# Altium project OFP_CIM_v1.5.PrjPcb (part 2 of 2)

## Sheet Power-Processor-3-Sheet.SchDoc
size 420 x 297 mm; SheetNumber: 3; SheetTotal: 4
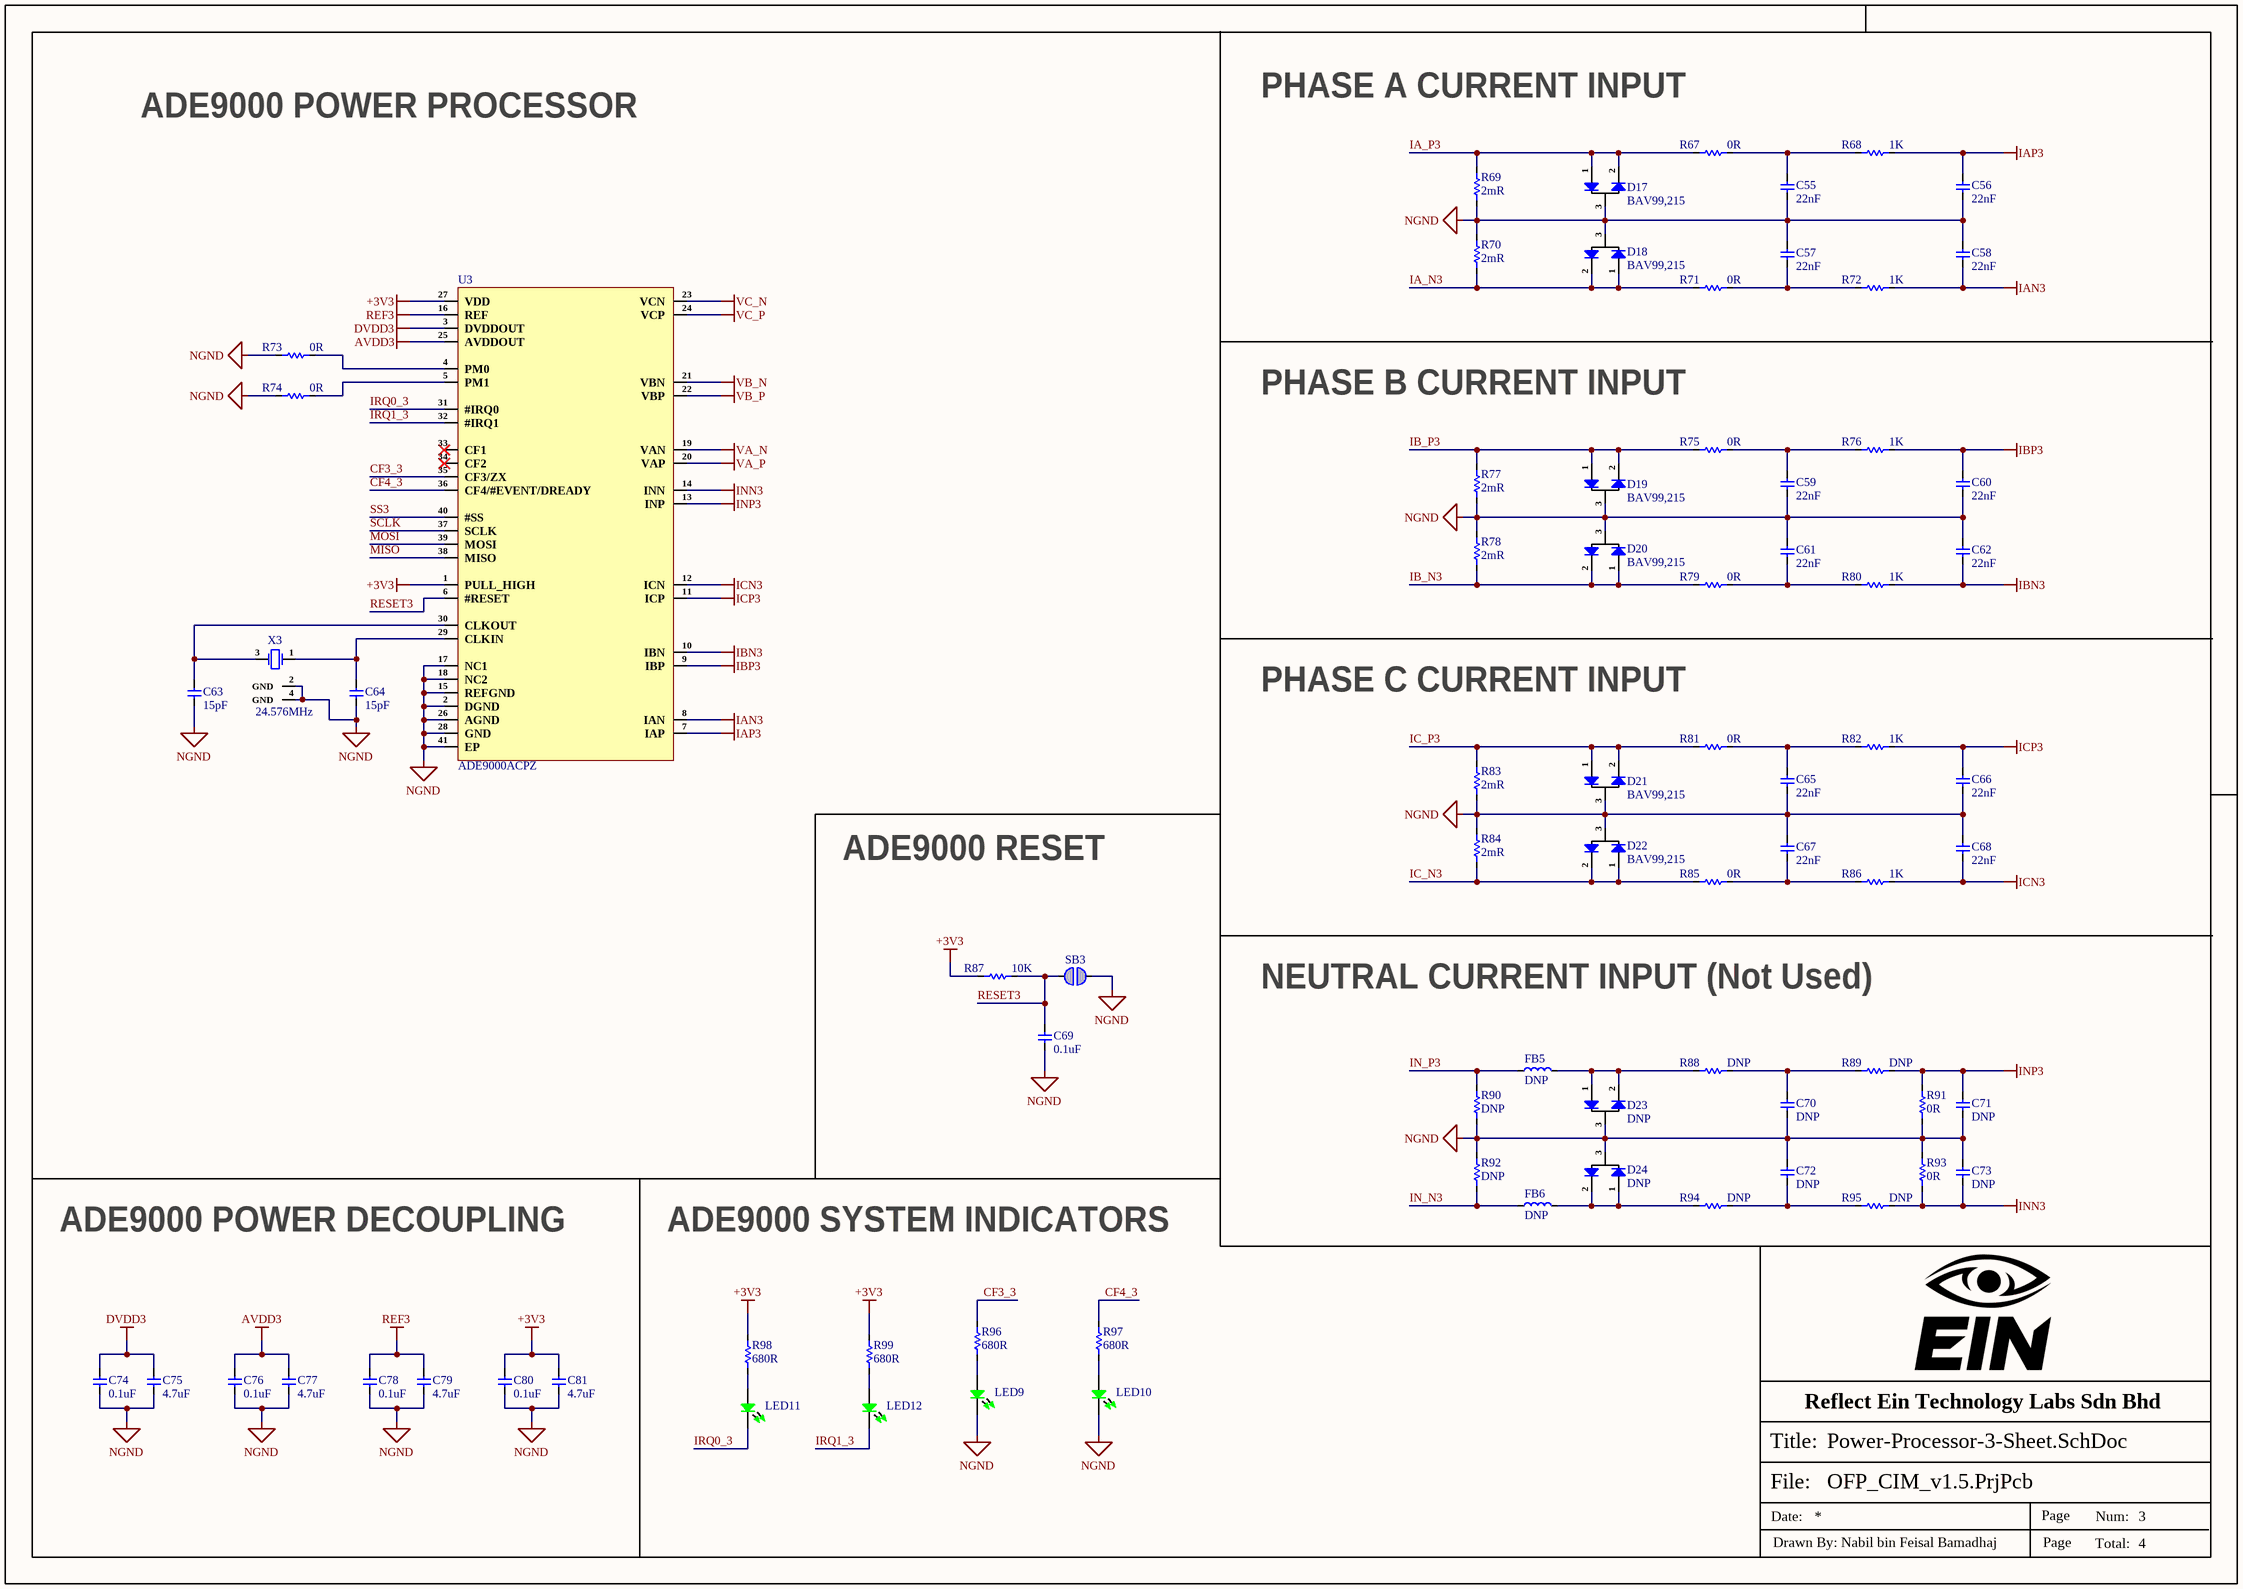
[diagram p2: Power-Processor-3-Sheet.SchDoc]

### Parts
C55  22nF  [Cap-0805]
C56  22nF  [Cap-0805]
C57  22nF  [Cap-0805]
C58  22nF  [Cap-0805]
C59  22nF  [Cap-0805]
C60  22nF  [Cap-0805]
C61  22nF  [Cap-0805]
C62  22nF  [Cap-0805]
C63  15pF  [Cap-0603]
C64  15pF  [Cap-0603]
C65  22nF  [Cap-0805]
C66  22nF  [Cap-0805]
C67  22nF  [Cap-0805]
C68  22nF  [Cap-0805]
C69  0.1uF  [Cap-0603]
C70  DNP  [Cap-0805]  (no BOM)
C71  DNP  [Cap-0805]  (no BOM)
C72  DNP  [Cap-0805]  (no BOM)
C73  DNP  [Cap-0805]  (no BOM)
C74  0.1uF  [Cap-0603]
C75  4.7uF  [Cap-0603]
C76  0.1uF  [Cap-0603]
C77  4.7uF  [Cap-0603]
C78  0.1uF  [Cap-0603]
C79  4.7uF  [Cap-0603]
C80  0.1uF  [Cap-0603]
C81  4.7uF  [Cap-0603]
D17  BAV99,215  [SOT-23]
D18  BAV99,215  [SOT-23]
D19  BAV99,215  [SOT-23]
D20  BAV99,215  [SOT-23]
D21  BAV99,215  [SOT-23]
D22  BAV99,215  [SOT-23]
D23  DNP  [SOT-23]  (no BOM)
D24  DNP  [SOT-23]  (no BOM)
FB5  DNP  [Ind-0805]  (no BOM)
FB6  DNP  [Ind-0805]  (no BOM)
LED9  Emerald  [LED-0603]  (value not drawn)
LED10  Emerald  [LED-0603]  (value not drawn)
LED11  Emerald  [LED-0603]  (value not drawn)
LED12  Emerald  [LED-0603]  (value not drawn)
R67  0R  [Res-0603]
R68  1K  [Res-0603]
R69  2mR  [RES-2512]
R70  2mR  [RES-2512]
R71  0R  [Res-0603]
R72  1K  [Res-0603]
R73  0R  [Res-0603]
R74  0R  [Res-0603]
R75  0R  [Res-0603]
R76  1K  [Res-0603]
R77  2mR  [RES-2512]
R78  2mR  [RES-2512]
R79  0R  [Res-0603]
R80  1K  [Res-0603]
R81  0R  [Res-0603]
R82  1K  [Res-0603]
R83  2mR  [RES-2512]
R84  2mR  [RES-2512]
R85  0R  [Res-0603]
R86  1K  [Res-0603]
R87  10K  [Res-0603]
R88  DNP  [Res-0603]  (no BOM)
R89  DNP  [Res-0603]  (no BOM)
R90  DNP  [RES-2512]  (no BOM)
R91  0R  [Res-0603]
R92  DNP  [RES-2512]  (no BOM)
R93  0R  [Res-0603]
R94  DNP  [Res-0603]  (no BOM)
R95  DNP  [Res-0603]  (no BOM)
R96  680R  [Res-0603]
R97  680R  [Res-0603]
R98  680R  [Res-0603]
R99  680R  [Res-0603]
SB3  Solder Bridge 0603  [Solder Bridge]  (value not drawn)  (no BOM)
U3  ADE9000ACPZ  [40-LFCSP-WQ (6x6)]
X3  24.576MHz  [SMD3225-4P]

### Nets
+3V3: C80.2 C81.2 R87.1 R98.2 R99.2 U3.1(PULL_HIGH) U3.27(VDD)
AVDD3: C76.2 C77.2 U3.25(AVDDOUT)
DVDD3: C74.2 C75.2 U3.3(DVDDOUT)
IAN3: C58.1 R72.2 U3.8(IAN)
IAP3: C56.2 R68.2 U3.7(IAP)
IBN3: C62.1 R80.2 U3.10(IBN)
IBP3: C60.2 R76.2 U3.9(IBP)
ICN3: C68.1 R86.2 U3.12(ICN)
ICP3: C66.2 R82.2 U3.11(ICP)
INN3: C73.1 R93.1 R95.2 U3.14(INN)
INP3: C71.2 R89.2 R91.2 U3.13(INP)
NGND: C55.1 C56.1 C57.2 C58.2 C59.1 C60.1 C61.2 C62.2 C63.1 C64.1 C65.1 C66.1 C67.2 C68.2 C69.1 C70.1 C71.1 C72.2 C73.2 C74.1 C75.1 C76.1 C77.1 C78.1 C79.1 C80.1 C81.1 D17.3 D18.3 D19.3 D20.3 D21.3 D22.3 D23.3 D24.3 LED9.2 LED10.2 R69.1 R70.2 R73.1 R74.1 R77.1 R78.2 R83.1 R84.2 R90.1 R91.1 R92.2 R93.2 SB3.1 U3.2(DGND) U3.15(REFGND) U3.17(NC1) U3.18(NC2) U3.26(AGND) U3.28(GND) U3.41(EP) X3.2(GND) X3.4(GND)
REF3: C78.2 C79.2 U3.16(REF)
VA_N: U3.19(VAN)
VA_P: U3.20(VAP)
VB_N: U3.21(VBN)
VB_P: U3.22(VBP)
VC_N: U3.23(VCN)
VC_P: U3.24(VCP)
CF3_3: R96.2 U3.35(CF3/ZX)
CF4_3: R97.2 U3.36(CF4/#EVENT/DREADY)
IA_N3: D18.1 D18.2 R70.1 R71.1
IA_P3: D17.1 D17.2 R67.1 R69.2
IB_N3: D20.1 D20.2 R78.1 R79.1
IB_P3: D19.1 D19.2 R75.1 R77.2
IC_N3: D22.1 D22.2 R84.1 R85.1
IC_P3: D21.1 D21.2 R81.1 R83.2
IN_N3: FB6.1 R92.1
IN_P3: FB5.1 R90.2
IRQ0_3: LED11.2 U3.31(#IRQ0)
IRQ1_3: LED12.2 U3.32(#IRQ1)
MISO: U3.38(MISO)
MOSI: U3.39(MOSI)
RESET3: C69.2 R87.2 SB3.2 U3.6(#RESET)
SCLK: U3.37(SCLK)
SS3: U3.40(#SS)
NetC55_2: C55.2 R67.2 R68.1
NetC57_1: C57.1 R71.2 R72.1
NetC59_2: C59.2 R75.2 R76.1
NetC61_1: C61.1 R79.2 R80.1
NetC63_2: C63.2 U3.30(CLKOUT) X3.3(CRYSTAL)
NetC64_2: C64.2 U3.29(CLKIN) X3.1(CRYSTAL)
NetC65_2: C65.2 R81.2 R82.1
NetC67_1: C67.1 R85.2 R86.1
NetC70_2: C70.2 R88.2 R89.1
NetC72_1: C72.1 R94.2 R95.1
NetD23_1: D23.1 D23.2 FB5.2 R88.1
NetD24_1: D24.1 D24.2 FB6.2 R94.1
NetLED9_1: LED9.1 R96.1
NetLED10_1: LED10.1 R97.1
NetLED11_1: LED11.1 R98.1
NetLED12_1: LED12.1 R99.1
NetR73_2: R73.2 U3.4(PM0)
NetR74_2: R74.2 U3.5(PM1)

Not connected (* = marked no-connect by the designer): U3 33(CF1)* 34(CF2)*

### Notes on the sheet
- ADE9000 POWER PROCESSOR
- PHASE A CURRENT INPUT
- PHASE B CURRENT INPUT
- PHASE C CURRENT INPUT
- ADE9000 RESET
- NEUTRAL CURRENT INPUT (Not Used)
- ADE9000 POWER DECOUPLING
- ADE9000 SYSTEM INDICATORS
- Reflect Ein Technology Labs Sdn Bhd
- File:
- Title:
- Date:
- Page
- Num:
- Total:
- Drawn By: Nabil bin Feisal Bamadhaj

### Library data of the parts
C55-C62 C65-C68 C70-C73 = GRM21B5C1H223JA01L: CAP CER 0.022UF 50V C0G/NP0 0805; Manufacturer: Murata; Item Type: Capacitors; Supplier: Mouser; LCSC Part Number: C77069; Manufacturer Part Number: GRM21B5C1H223JA01L; RoHS: Yes; Stock: 33939; Pricing: 1=0.38, 10=0.162, 50=0.162, 100=0.108, 1000=0.089, 10000=0.065 (USD); Lead Free: 5697LeadFree; ComponentLink1URL: https://datasheet.ciiva.com/29042/1858738-29042965.pdf?src-supplier=Jameco; ComponentLink1Description: https://datasheet.ciiva.com/29042/1858738-29042965.pdf?src-supplier=Jameco; ComponentLink2URL: https://datasheet.ciiva.com/2989/product-2989681.pdf?src-supplier=Avnet; ComponentLink2Description: https://datasheet.ciiva.com/2989/product-2989681.pdf?src-supplier=Avnet; ComponentLink3URL: https://datasheet.ciiva.com/3777/99grm21b5c1h223ja0123-3777023.pdf?src-supplier=Arrow+Electronics; ComponentLink3Description: https://datasheet.ciiva.com/3777/99grm21b5c1h223ja0123-3777023.pdf?src-supplier=Arrow+Electronics; ComponentLink4URL: https://datasheet.ciiva.com/29200/453051-da-01-en-vs-kondensator-0805-29200670.pdf?src-supplier=Conrad; ComponentLink4Description: https://datasheet.ciiva.com/29200/453051-da-01-en-vs-kondensator-0805-29200670.pdf?src-supplier=Conrad; ComponentLink5URL: https://datasheet.ciiva.com/138/partnumbering-e-01-138787.pdf?src-supplier=Digikey; ComponentLink5Description: https://datasheet.ciiva.com/138/partnumbering-e-01-138787.pdf?src-supplier=Digikey; ComponentLink6URL: https://datasheet.ciiva.com/138/partnumbering-e-01-138788.pdf?src-supplier=Digikey; ComponentLink6Description: https://datasheet.ciiva.com/138/partnumbering-e-01-138788.pdf?src-supplier=Digikey; ComponentLink7URL: https://datasheet.ciiva.com/138/partnumbering-e-01-138789.pdf?src-supplier=Digikey; ComponentLink7Description: https://datasheet.ciiva.com/138/partnumbering-e-01-138789.pdf?src-supplier=Digikey; ComponentLink8URL: https://datasheet.ciiva.com/22703/608985-22703464.pdf?src-supplier=Element14; ComponentLink8Description: https://datasheet.ciiva.com/22703/608985-22703464.pdf?src-supplier=Element14; ComponentLink9URL: https://datasheet.ciiva.com/7828/608985-7828990.pdf?src-supplier=Element14; ComponentLink9Description: https://datasheet.ciiva.com/7828/608985-7828990.pdf?src-supplier=Element14
C63 C64 = CC0603JRNPO9BN150: CAP CER 15PF 50V C0G/NPO 0603; Manufacturer: Yageo; Dielectric Material: Ceramic; Tolerance: 5%; Dielectric: C0G; Insulation Resistance: 100GR; Item Type: Capacitor; Supplier 1: Future Electronics; Manufacturer Part Number: CC0603JRNPO9BN150; RoHS: Yes; Category: Ceramic Capacitors; Stock 1: 832000; Pricing 1: 4000=0.0038, 16000=0.0036, 80000=0.0034, 160000=0.0033, 500000=0.0031 (USD); Mounting Technology: Surface Mount; Case/Package: 0603; Pins: 2; Case Code (Metric): 1608; Case Code (Imperial): 0603; Min Operating Temperature: -55°C; Max Operating Temperature: 125°C; Value: 15pF; Series: CC; Packaging: Tape and Reel; Package Quantity: 1; Termination: SMD/SMT; Voltage Rating: 50V; Length: 1.6mm; Width: 0.031inch; Height: 0.8mm; Depth: 0.8mm; Thickness: 0.035inch; Radiation Hardening: No; RoHS Compliant: Yes; Reach SVHC Compliant: No; Lead Free: Lead Free; ComponentLink1URL: https://datasheet.ciiva.com/144/mlccorderingcode-144635.pdf?src-supplier=Digi-Key; ComponentLink1Description: https://datasheet.ciiva.com/144/mlccorderingcode-144635.pdf?src-supplier=Digi-Key; ComponentLink2URL: https://datasheet.ciiva.com/144/mlccorderingcode-144636.pdf?src-supplier=Digi-Key; ComponentLink2Description: https://datasheet.ciiva.com/144/mlccorderingcode-144636.pdf?src-supplier=Digi-Key; ComponentLink3URL: https://datasheet.ciiva.com/8033/1443161-8033721.pdf?src-supplier=Element14; ComponentLink3Description: https://datasheet.ciiva.com/8033/1443161-8033721.pdf?src-supplier=Element14; ComponentLink4URL: https://datasheet.ciiva.com/28450/1443161-28450472.pdf?src-supplier=Element14; ComponentLink4Description: https://datasheet.ciiva.com/28450/1443161-28450472.pdf?src-supplier=Element14; ComponentLink5URL: https://datasheet.ciiva.com/144/mlccorderingcode-144634.pdf?src-supplier=Digi-Key; ComponentLink5Description: https://datasheet.ciiva.com/144/mlccorderingcode-144634.pdf?src-supplier=Digi-Key; ComponentLink6URL: https://datasheet.ciiva.com/8033/1734582-8033723.pdf?src-supplier=Element14; ComponentLink6Description: https://datasheet.ciiva.com/8033/1734582-8033723.pdf?src-supplier=Element14; ComponentLink7URL: https://datasheet.ciiva.com/8033/1734582-8033722.pdf?src-supplier=Element14; ComponentLink7Description: https://datasheet.ciiva.com/8033/1734582-8033722.pdf?src-supplier=Element14; ComponentLink8URL: https://datasheet.ciiva.com/11464/upy-gp-np0-16v-to-50v-8-11464727.pdf?src-supplier=Avnet; ComponentLink8Description: https://datasheet.ciiva.com/11464/upy-gp-np0-16v-to-50v-8-11464727.pdf?src-supplier=Avnet; Supplier Part Number 1: 4234670; LCSC Part Number: C107037
C69 C74 C76 C78 C80 = GCJ188R71H104KA12D: CAP CER 0.1UF 50V X7R 0603; Manufacturer: Murata; Item Type: Capacitors; Material: 4241ConductorMaterial; Value: 100nF; Tolerance: 10%; Supplier: Mouser; LCSC Part Number: C161115; Manufacturer Part Number: GCJ188R71H104KA12D; RoHS: Yes; Stock: 342536; Pricing: 1=0.13, 10=0.056, 50=0.056, 100=0.036, 1000=0.032, 10000=0.02 (USD); Mounting Technology: Surface Mount; Case/Package: 0603; Case Code (Metric): 1608; Case Code (Imperial): 0603; Min Operating Temperature: -55°C; Max Operating Temperature: 125°C; Dielectric: X7R; Package Quantity: 1; Voltage Rating: 50V; Packaging: Tape and Reel; Voltage Rating (DC): 50V; Termination: SMD/SMT; Features: Soft Termination; Series: GCJ; Construction: Flat; Length: 1.6mm; Width: 0.031inch; Height: 0.8mm; Thickness: 0.035inch; Depth: 0.8mm; Ratings: AEC-Q200; Radiation Hardening: No; RoHS Compliant: Yes; Lead Free: 5697LeadFree; ComponentLink1URL: https://datasheet.ciiva.com/135/product-135604.pdf?src-supplier=Digikey; ComponentLink1Description: https://datasheet.ciiva.com/135/product-135604.pdf?src-supplier=Digikey; ComponentLink2URL: https://datasheet.ciiva.com/26889/getdatasheetpartid-369886-26889118.pdf?src-supplier=Verical; ComponentLink2Description: https://datasheet.ciiva.com/26889/getdatasheetpartid-369886-26889118.pdf?src-supplier=Verical; ComponentLink3URL: https://datasheet.ciiva.com/135/s0717e-135605.pdf?src-supplier=Digikey; ComponentLink3Description: https://datasheet.ciiva.com/135/s0717e-135605.pdf?src-supplier=Digikey; ComponentLink4URL: https://datasheet.ciiva.com/135/s0717e-135606.pdf?src-supplier=Digikey; ComponentLink4Description: https://datasheet.ciiva.com/135/s0717e-135606.pdf?src-supplier=Digikey; ComponentLink5URL: https://datasheet.ciiva.com/16440/c03e-16440425.pdf?src-supplier=Future+Electronics; ComponentLink5Description: https://datasheet.ciiva.com/16440/c03e-16440425.pdf?src-supplier=Future+Electronics
C75 C77 C79 C81 = GRM188Z71A475KE15D: CAP CER 4.7UF 10V X7R 0603; Manufacturer: Murata; Item Type: Capacitors; Material: 4241ConductorMaterial; Tolerance: 10%; Supplier: Mouser; LCSC Part Number: C913474; Manufacturer Part Number: GRM188Z71A475KE15D; RoHS: Yes; Stock: 33218; Pricing: 1=0.24, 10=0.1, 50=0.1, 100=0.063, 1000=0.055, 10000=0.041 (USD); Case/Package: 0603; Min Operating Temperature: -55°C; Max Operating Temperature: 125°C; Value: 4.7uF; Voltage Rating: 10V; Length: 1.6mm; Width: 800um; Height: 950um; Thickness: 800um; RoHS Compliant: Yes; ComponentLink1URL: https://datasheet.octopart.com/GRM188Z71A475KE15D-Murata-datasheet-149523299.pdf?src-supplier=Newark; ComponentLink1Description: https://datasheet.octopart.com/GRM188Z71A475KE15D-Murata-datasheet-149523299.pdf?src-supplier=Newark; ComponentLink2URL: https://datasheet.octopart.com/GRM188Z71A475KE15D-Murata-datasheet-165579666.pdf?src-supplier=TME; ComponentLink2Description: https://datasheet.octopart.com/GRM188Z71A475KE15D-Murata-datasheet-165579666.pdf?src-supplier=TME
D17-D24 = BAV99,215: DIODE ARR GP 100V 215MA TO-236AB; Manufacturer: Nexperia; Item Type: Diodes; Forward Voltage: 1.25V; Breakdown Voltage: 75V; Forward Current: 125mA; Max Forward Surge Current (Ifsm): 500mA; Max Reverse Current: 500nA; Value: 1.5pF; Supplier: Future Electronics; LCSC Part Number: C2500; Manufacturer Part Number: BAV99,215; RoHS: Yes; Stock: 20217000; Pricing: 3000=0.008, 12000=0.0077, 30000=0.0075, 75000=0.0073, 120000=0.007 (USD); Pins: 3NUMBER; Max Operating Temperature: 150°C; Max Repetitive Reverse Voltage (Vrrm): 100V; Reverse Voltage: 100V; Height: 1.1mm; RoHS Compliant: Yes; ComponentLink1URL: http://www.farnell.com/datasheets/953882.pdf?src-supplier=Farnell; ComponentLink1Description: http://www.farnell.com/datasheets/953882.pdf?src-supplier=Farnell; ComponentLink2URL: http://www.farnell.com/datasheets/953882.pdf?src-supplier=Newark; ComponentLink2Description: http://www.farnell.com/datasheets/953882.pdf?src-supplier=Newark; ComponentLink3URL: https://datasheet.octopart.com/BAV99%2C215-Nexperia-datasheet-10109661.pdf?src-supplier=Element14; ComponentLink3Description: https://datasheet.octopart.com/BAV99%2C215-Nexperia-datasheet-10109661.pdf?src-supplier=Element14; ComponentLink4URL: https://assets.nexperia.com/documents/data-sheet/BAV99_SER.pdf?src-supplier=Digikey; ComponentLink4Description: https://assets.nexperia.com/documents/data-sheet/BAV99_SER.pdf?src-supplier=Digikey; ComponentLink5URL: https://datasheet.octopart.com/BAV99%2C215-Nexperia-datasheet-87580883.pdf?src-supplier=Newark; ComponentLink5Description: https://datasheet.octopart.com/BAV99%2C215-Nexperia-datasheet-87580883.pdf?src-supplier=Newark
FB5 FB6 = BLM21BD152SN1D: FERRITE BEAD 1.5 KOHM 0805 1LN; Manufacturer: Murata; Item Type: Ferrite Beads; RMS Current (Irms): 250mA; ESR: 450mR; Shielding: 202Shielding; Frequency: 100MHz; Number of Circuits: 1NUMBER; Supplier: Mouser; LCSC Part Number: C413959; Manufacturer Part Number: BLM21BD152SN1D; RoHS: Yes; Stock: 31999; Pricing: 1=0.21, 10=0.114, 50=0.114, 100=0.102, 1000=0.068, 10000=0.048 (USD); Lead Free: 5697LeadFree; ComponentLink1URL: https://datasheet.ciiva.com/19454/1845267-19454720.pdf?src-supplier=Jameco; ComponentLink1Description: https://datasheet.ciiva.com/19454/1845267-19454720.pdf?src-supplier=Jameco; ComponentLink2URL: https://datasheet.ciiva.com/14122/amblm21b-data-e-14122891.pdf?src-supplier=Distrelec; ComponentLink2Description: https://datasheet.ciiva.com/14122/amblm21b-data-e-14122891.pdf?src-supplier=Distrelec; ComponentLink3URL: https://datasheet.ciiva.com/6211/l0110s0100blm21b-6211484.pdf?src-supplier=Digikey; ComponentLink3Description: https://datasheet.ciiva.com/6211/l0110s0100blm21b-6211484.pdf?src-supplier=Digikey; ComponentLink4URL: https://datasheet.ciiva.com/6211/l0110s0100blm21b-6211486.pdf?src-supplier=Digikey; ComponentLink4Description: https://datasheet.ciiva.com/6211/l0110s0100blm21b-6211486.pdf?src-supplier=Digikey; ComponentLink5URL: https://datasheet.ciiva.com/6211/l0110s0100blm21b-6211487.pdf?src-supplier=Digikey; ComponentLink5Description: https://datasheet.ciiva.com/6211/l0110s0100blm21b-6211487.pdf?src-supplier=Digikey; ComponentLink6URL: https://datasheet.ciiva.com/16420/l0110s0100blm21b-16420715.pdf?src-supplier=Future+Electronics; ComponentLink6Description: https://datasheet.ciiva.com/16420/l0110s0100blm21b-16420715.pdf?src-supplier=Future+Electronics; ComponentLink7URL: https://datasheet.ciiva.com/17277/l0110s0100blm21b-17277370.pdf?; ComponentLink7Description: https://datasheet.ciiva.com/17277/l0110s0100blm21b-17277370.pdf?
LED9-LED12 = NCD0603G2: Emerald 0603 Light Emitting Diodes (LED) ROHS; Manufacturer: Foshan NationStar Optoelectronics; Manufacturer Part Number: NCD0603G2; Package: 0603; LCSC Part Number: C87326; Item Type: LED; ComponentLink1Description: LCSC; ComponentLink1URL: https://www.lcsc.com/product-detail/Light-Emitting-Diodes-LED_Foshan-NationStar-Optoelectronics-NCD0603G2_C87326.html
R67 R71 R73-R75 R79 R81 R85 R88 R91 R93 R94 = RC0603FR-070RL: RES SMD 0R, 1%, 0.1W, 0603; Manufacturer: Yageo; Item Type: Resistor; Manufacturer Part Number: RC0603FR-070RL; Package: 0603; LCSC Part Number: C100044; ComponentLink9Description: LCSC; ComponentLink9URL: https://www.lcsc.com/product-detail/Chip-Resistor-Surface-Mount_YAGEO-RC0603FR-070RL_C100044.html
R68 R72 R76 R80 R82 R86 R89 R95 = RC0603FR-071KL: RES SMD 1K OHM 1% 1/10W 0603; Manufacturer: Yageo; Resistance: 1kR; Temperature Coefficient: 100ppm/°C; Power Rating: 100mW; Voltage Rating: 50V; Item type: Resistor; ComponentLink1URL: https://www.verical.com/server-webapp/html/getDatasheet?partID=409289&src-supplier=Verical; ComponentLink1Description: https://www.verical.com/server-webapp/html/getDatasheet?partID=409289&src-supplier=Verical; Supplier 1: Digi-Key; Manufacturer Part Number: RC0603FR-071KL; Stock 1: 21472395; Pricing 1: 1=0.1, 10=0.023, 100=0.0094, 1000=0.0042, 2500=0.0037 (USD); Case/Package: 0603; Contact Plating: Tin,Matte; Case Code (Imperial): 0603; Case Code (Metric): 1608; Min Operating Temperature: -55°C; Max Operating Temperature: 155°C; Tolerance: 1%; Composition: Thick Film; Packaging: Tape and Reel; Termination: SMD/SMT; Military Standard: Not; Length: 1.6mm; Height: 0.45mm; Depth: 0.8mm; Radiation Hardening: No; REACH SVHC: No SVHC; Lead Free: Lead Free; ComponentLink2URL: http://documents.rs-components.com/techlib://itc_doclist_GB.htm?stockno=5048928&src-supplier=RSComponents; ComponentLink2Description: http://documents.rs-components.com/techlib://itc_doclist_GB.htm?stockno=5048928&src-supplier=RSComponents; ComponentLink3URL: http://www.yageo.com/documents/recent/PYu-RC0603_51_RoHS_L_4.pdf?src-supplier=Avnet+Europe; ComponentLink3Description: http://www.yageo.com/documents/recent/PYu-RC0603_51_RoHS_L_4.pdf?src-supplier=Avnet+Europe; ComponentLink4URL: http://www.farnell.com/datasheets/2167052.pdf?src-supplier=Element14; ComponentLink4Description: http://www.farnell.com/datasheets/2167052.pdf?src-supplier=Element14; ComponentLink5URL: http://www.farnell.com/datasheets/1868787.pdf?src-supplier=Element14; ComponentLink5Description: http://www.farnell.com/datasheets/1868787.pdf?src-supplier=Element14; ComponentLink6URL: http://www.yageo.com/documents/recent/PYu-RC_Group_51_RoHS_L_2.pdf?src-supplier=Avnet; ComponentLink6Description: http://www.yageo.com/documents/recent/PYu-RC_Group_51_RoHS_L_2.pdf?src-supplier=Avnet; ComponentLink7URL: https://www.verical.com/server-webapp/html/getDatasheet?partID=404327&src-supplier=Verical; ComponentLink7Description: https://www.verical.com/server-webapp/html/getDatasheet?partID=404327&src-supplier=Verical; ComponentLink8URL: http://www.farnell.com/datasheets/443971.pdf?src-supplier=Element14; ComponentLink8Description: http://www.farnell.com/datasheets/443971.pdf?src-supplier=Element14; Supplier Part Number 1: 311-1.00KHRDKR-ND; LCSC Part Number: C22548
R69 R70 R77 R78 R83 R84 R90 R92 = PA2512FKE7T0R002E: RES 0.002 OHM 1% 3W 2512; Manufacturer: Yageo; Item Type: Resistors; Supplier: Digikey; LCSC Part Number: C375692; Manufacturer Part Number: PA2512FKE7T0R002E; RoHS: Yes; Stock: 3531; Pricing: 1=0.87, 10=0.754, 25=0.662, 50=0.5936, 100=0.5253, 250=0.45696, 500=0.37944, 1000=0.31212 (USD)
R87 = RC0603FR-0710KL: RES SMD 10K Ohm 1% 1/10W 0603; Manufacturer: Yageo; Resistance: 10kR; Temperature Coefficient: 100ppm/°C; Voltage Rating (DC): 50V; Power Rating: 100mW; Voltage Rating: 75V; Item Type: Resistor; Supplier 1: Digi-Key; Manufacturer Part Number: RC0603FR-0710KL; RoHS: Yes; Category: Chip SMD Resistors; Stock 1: 25249139; Pricing 1: 1=0.10000, 10=0.02400, 100=0.00970, 1000=0.00436, 2500=0.00378 (USD); Case/Package: 0603; Number of Pins: 2; Case Code (Imperial): 0603; Case Code (Metric): 1608; Weight: 7.1E-05oz; Size Code: 0603; Min Operating Temperature: -55°C; Max Operating Temperature: 155°C; Tolerance: 1%; Resistor Type: Thick Film; Packaging: Tape and Reel; Termination: SMD/SMT; Features: Moisture Resistant; Series: RC; Max Power Dissipation: 100mW; Number of Terminations: 2; Resistance Tolerance: 1%; Construction: Rectangular; Length: 1.6mm; Width: 0.8mm; Height: 0.45mm; Depth: 0.8mm; Lead Pitch: 0.3mm; REACH SVHC: Unknown; Lead Free: Lead Free; Military Standard: Not; RoHS Compliant: Yes; ComponentLink1URL: https://datasheet.ciiva.com/7660/38590-7660789.pdf?src-supplier=Element14; ComponentLink1Description: https://datasheet.ciiva.com/7660/38590-7660789.pdf?src-supplier=Element14; ComponentLink2URL: https://datasheet.ciiva.com/7983/443971-7983596.pdf?src-supplier=Element14; ComponentLink2Description: https://datasheet.ciiva.com/7983/443971-7983596.pdf?src-supplier=Element14; ComponentLink3URL: https://datasheet.ciiva.com/22747/443971-22747519.pdf?src-supplier=Element14; ComponentLink3Description: https://datasheet.ciiva.com/22747/443971-22747519.pdf?src-supplier=Element14; ComponentLink4URL: https://datasheet.ciiva.com/46440/1868787-46440891.pdf?src-supplier=Element14; ComponentLink4Description: https://datasheet.ciiva.com/46440/1868787-46440891.pdf?src-supplier=Element14; ComponentLink5URL: https://datasheet.ciiva.com/7746/1738695-7746239.pdf?src-supplier=Element14; ComponentLink5Description: https://datasheet.ciiva.com/7746/1738695-7746239.pdf?src-supplier=Element14; ComponentLink6URL: https://datasheet.ciiva.com/15189/getdatasheetpartid-409289-15189591.pdf?src-supplier=Verical; ComponentLink6Description: https://datasheet.ciiva.com/15189/getdatasheetpartid-409289-15189591.pdf?src-supplier=Verical; Supplier Part Number 1: 311-10.0KHRCT-ND; LCSC Part Number: C98220
R96-R99 = RC0603FR-07680RL: RES SMD 680 OHM 1% 1/10W 0603; Manufacturer: Yageo; Item Type: Resistor; Manufacturer Part Number: RC0603FR-07680RL; Package: 0603; ComponentLink4URL: https://www.lcsc.com/product-detail/Chip-Resistor-Surface-Mount_YAGEO-RC0603FR-07680RL_C112310.html; ComponentLink4Description: LCSC; LCSC Part Number: C112310
SB3 = Solder Bridge 0603: Solder Bridge ON; Manufacturer Part Number: Solder Bridge; Item Type: Solder Bridge
U3 = ADE9000ACPZ: IC AFE 7 CHAN 40LFCSP-WQ; Manufacturer: Analog Devices; Supplier: Mouser; Supplier Part Number: 584-ADE9000ACPZ; Manufacturer Part Number: ADE9000ACPZ; RoHS: Yes; Item Type: IC; Stock: 7889; Pricing: 1=18.44, 10=13.35, 50=10.79, 100=10.79, 1000=10.52, 10000=10.52 (USD); ComponentLink1URL: http://www.farnell.com/datasheets/2280571.pdf?src-supplier=Farnell; ComponentLink1Description: http://www.farnell.com/datasheets/2280571.pdf?src-supplier=Farnell; ComponentLink2URL: https://datasheet.octopart.com/ADE9000ACPZ-Analog-Devices-datasheet-165826959.pdf?src-supplier=Element14; ComponentLink2Description: https://datasheet.octopart.com/ADE9000ACPZ-Analog-Devices-datasheet-165826959.pdf?src-supplier=Element14; ComponentLink3URL: https://www.analog.com/media/en/technical-documentation/data-sheets/ADE9000.pdf?src-supplier=Digikey; ComponentLink3Description: https://www.analog.com/media/en/technical-documentation/data-sheets/ADE9000.pdf?src-supplier=Digikey
X3 = X322524576MOB4SI: 24.576MHz Surface Mount Crystal 12pF ±10ppm ±20ppm SMD3225-4P Crystals ROHS; Manufacturer: YXC; Supplier: LCSC; LCSC Part Number: C70568; Manufacturer Part Number: X322524576MOB4SI; RoHS: No; Item Type: Crystal; ComponentLink1Description: LCSC; ComponentLink1URL: https://www.lcsc.com/product-detail/Crystals_YXC-Crystal-Oscillators-X322524576MOB4SI_C70568.html?s_z=n_X322524576MOB4SI

## Sheet Connectors-Sheet.SchDoc
size 420 x 297 mm; SheetNumber: 4; SheetTotal: 4
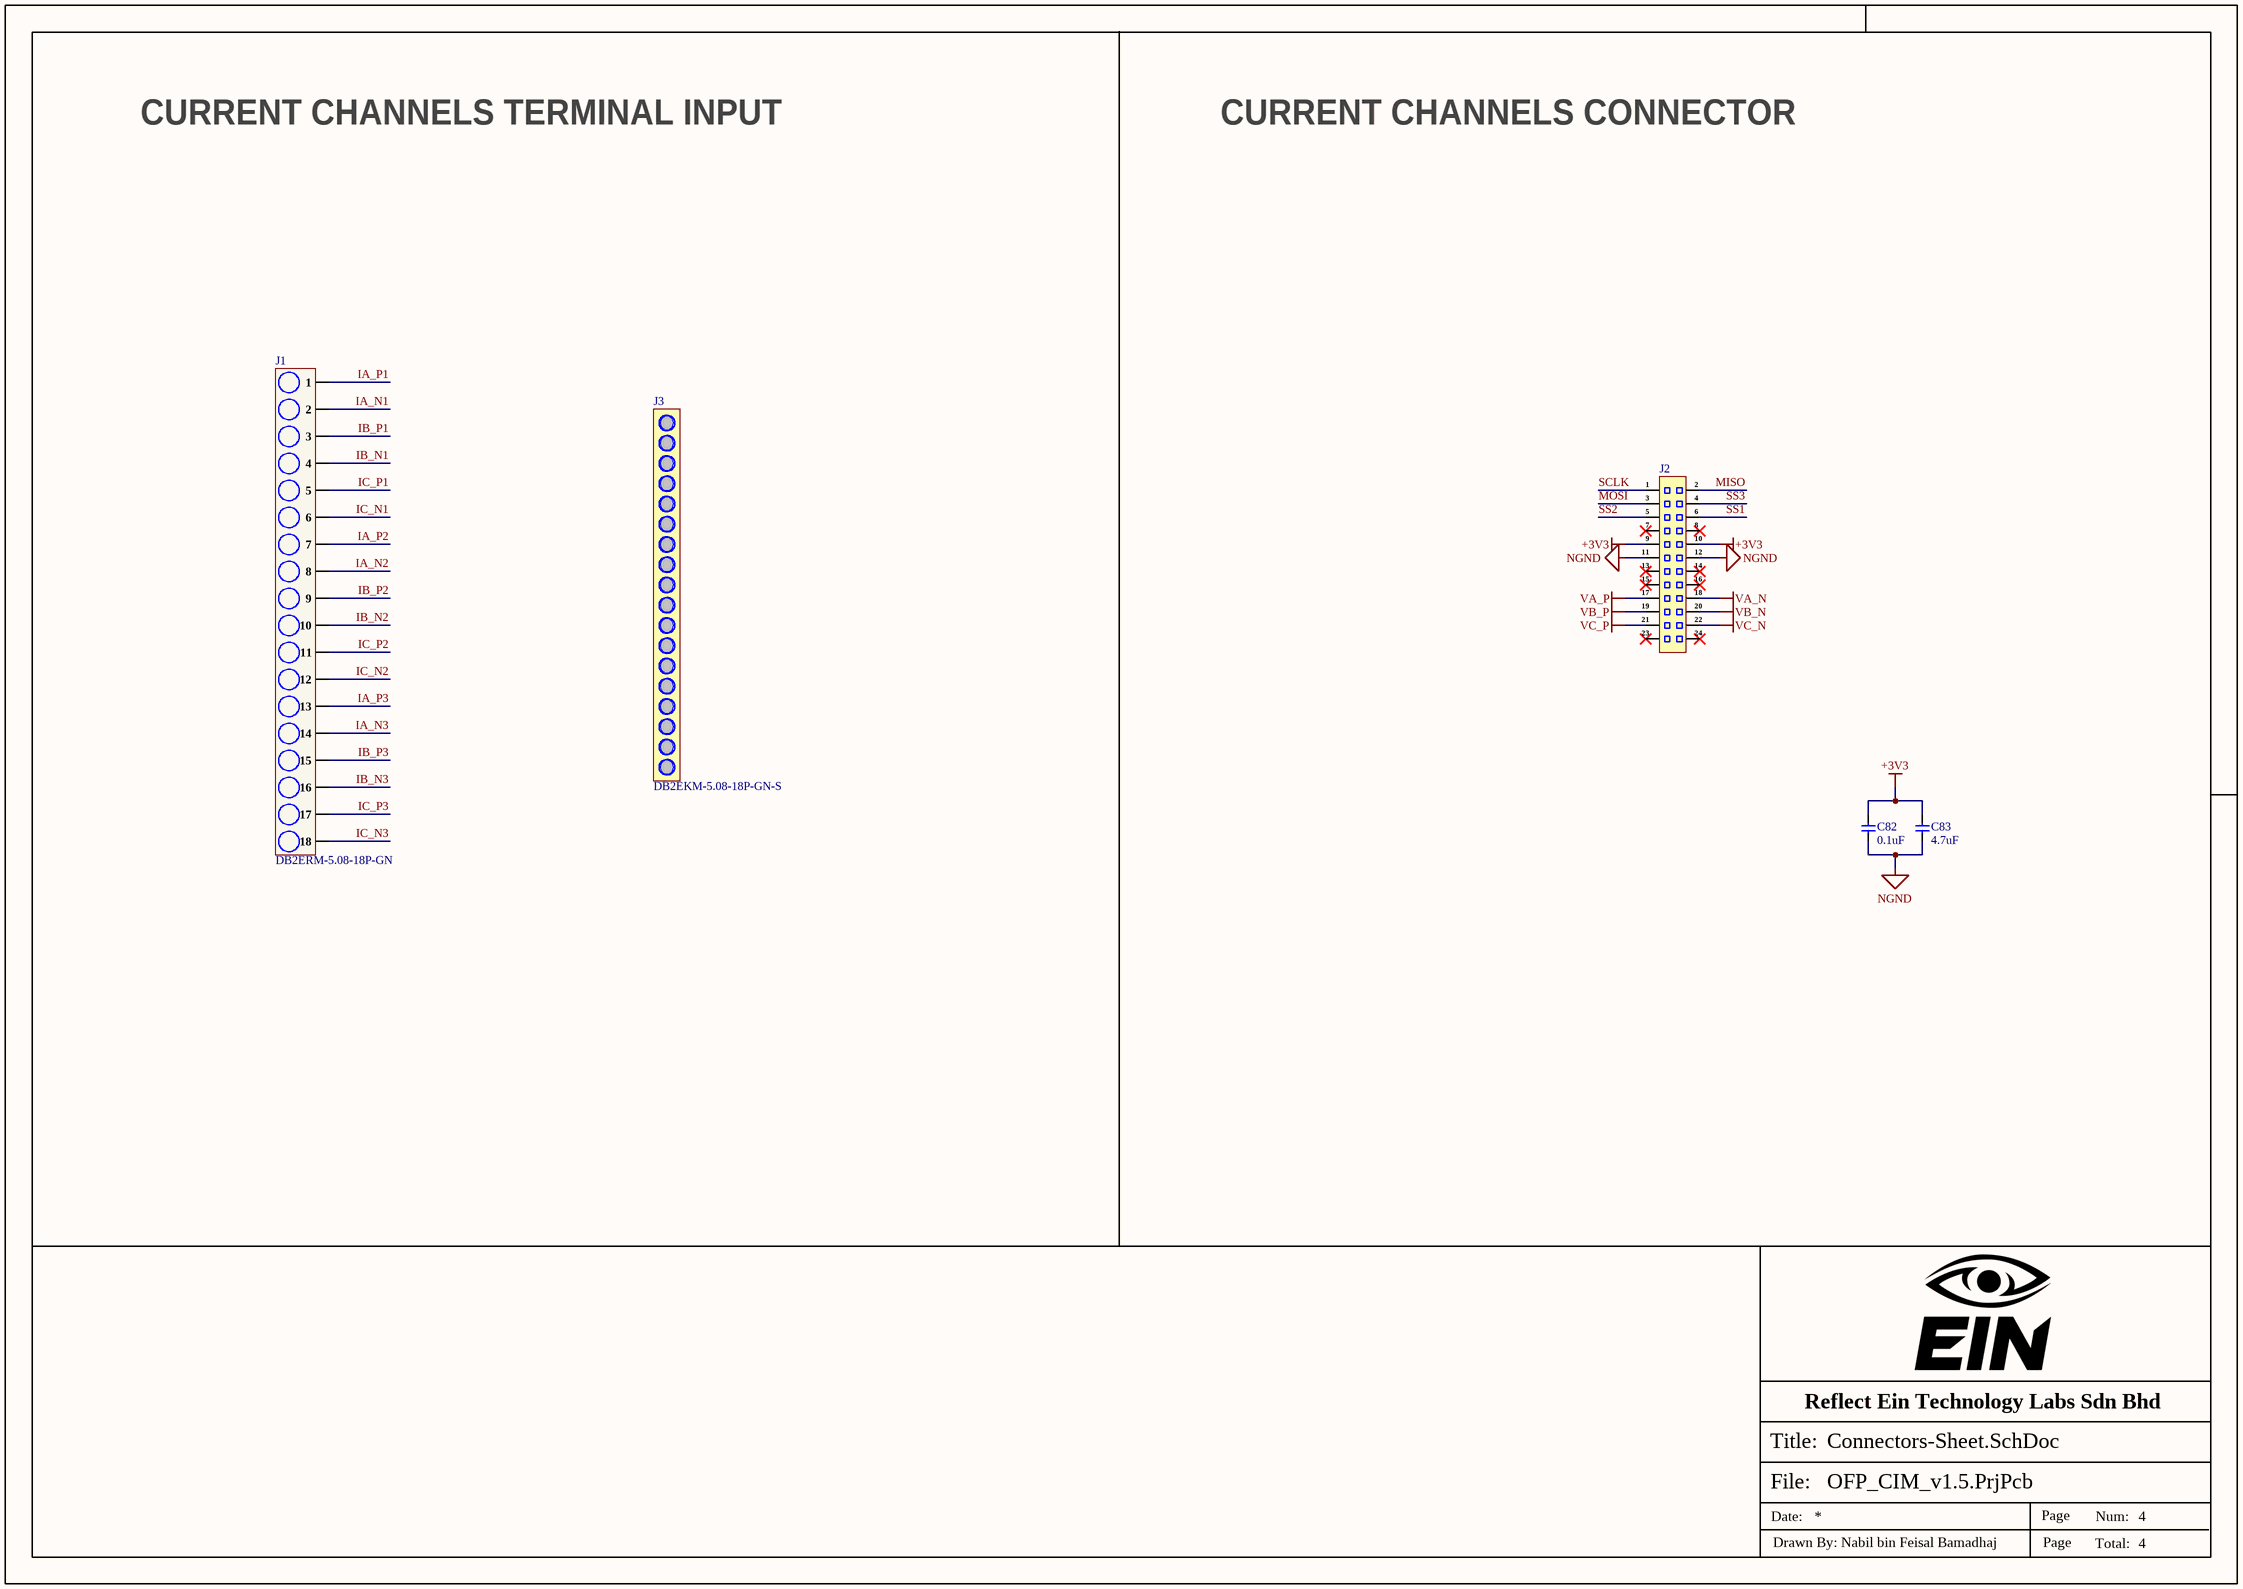
[diagram p3: Connectors-Sheet.SchDoc]

### Parts
C82  0.1uF  [Cap-0603]
C83  4.7uF  [Cap-0603]
J1  DB2ERM-5.08-18P-GN  [DB2ERM-5.08-18P-GN]
J2  SFH11-PBPC-D12-RA-BK  [SFH11-PBPC-D12-RA-BK]  (value not drawn)
J3  DB2EKM-5.08-18P-GN-S  (mechanical)

### Nets
+3V3: C82.2 C83.2 J2.9 J2.10
NGND: C82.1 C83.1 J2.11 J2.12
VA_N: J2.18
VA_P: J2.17
VB_N: J2.20
VB_P: J2.19
VC_N: J2.22
VC_P: J2.21
IA_N1: J1.2
IA_N2: J1.8
IA_N3: J1.14
IA_P1: J1.1
IA_P2: J1.7
IA_P3: J1.13
IB_N1: J1.4
IB_N2: J1.10
IB_N3: J1.16
IB_P1: J1.3
IB_P2: J1.9
IB_P3: J1.15
IC_N1: J1.6
IC_N2: J1.12
IC_N3: J1.18
IC_P1: J1.5
IC_P2: J1.11
IC_P3: J1.17
MISO: J2.2
MOSI: J2.3
SCLK: J2.1
SS1: J2.6
SS2: J2.5
SS3: J2.4

Not connected (* = marked no-connect by the designer): J2 7* 8* 13* 14* 15* 16* 23* 24*

### Notes on the sheet
- CURRENT CHANNELS TERMINAL INPUT
- CURRENT CHANNELS CONNECTOR
- Reflect Ein Technology Labs Sdn Bhd
- File:
- Title:
- Date:
- Page
- Num:
- Total:
- Drawn By: Nabil bin Feisal Bamadhaj

### Library data of the parts
C82 = GCJ188R71H104KA12D: as C69 on sheet Power-Processor-3-Sheet; Supplier: Mouser; LCSC Part Number: C161115; Manufacturer Part Number: GCJ188R71H104KA12D; RoHS: Yes; Stock: 342536; Pricing: 1=0.13, 10=0.056, 50=0.056, 100=0.036, 1000=0.032, 10000=0.02 (USD); Mounting Technology: Surface Mount; Case/Package: 0603; Case Code (Metric): 1608; Case Code (Imperial): 0603; Min Operating Temperature: -55°C; Max Operating Temperature: 125°C; Dielectric: X7R; Package Quantity: 1; Voltage Rating: 50V; Packaging: Tape and Reel; Voltage Rating (DC): 50V; Termination: SMD/SMT; Features: Soft Termination; Series: GCJ; Construction: Flat; Length: 1.6mm; Width: 0.031inch; Height: 0.8mm; Thickness: 0.035inch; Depth: 0.8mm; Ratings: AEC-Q200; Radiation Hardening: No; RoHS Compliant: Yes; Lead Free: 5697LeadFree; ComponentLink1URL: https://datasheet.ciiva.com/135/product-135604.pdf?src-supplier=Digikey; ComponentLink1Description: https://datasheet.ciiva.com/135/product-135604.pdf?src-supplier=Digikey; ComponentLink2URL: https://datasheet.ciiva.com/26889/getdatasheetpartid-369886-26889118.pdf?src-supplier=Verical; ComponentLink2Description: https://datasheet.ciiva.com/26889/getdatasheetpartid-369886-26889118.pdf?src-supplier=Verical; ComponentLink3URL: https://datasheet.ciiva.com/135/s0717e-135605.pdf?src-supplier=Digikey; ComponentLink3Description: https://datasheet.ciiva.com/135/s0717e-135605.pdf?src-supplier=Digikey; ComponentLink4URL: https://datasheet.ciiva.com/135/s0717e-135606.pdf?src-supplier=Digikey; ComponentLink4Description: https://datasheet.ciiva.com/135/s0717e-135606.pdf?src-supplier=Digikey; ComponentLink5URL: https://datasheet.ciiva.com/16440/c03e-16440425.pdf?src-supplier=Future+Electronics; ComponentLink5Description: https://datasheet.ciiva.com/16440/c03e-16440425.pdf?src-supplier=Future+Electronics
C83 = GRM188Z71A475KE15D: as C75 on sheet Power-Processor-3-Sheet; Supplier: Mouser; LCSC Part Number: C913474; Manufacturer Part Number: GRM188Z71A475KE15D; RoHS: Yes; Stock: 33218; Pricing: 1=0.24, 10=0.1, 50=0.1, 100=0.063, 1000=0.055, 10000=0.041 (USD); Case/Package: 0603; Min Operating Temperature: -55°C; Max Operating Temperature: 125°C; Value: 4.7uF; Voltage Rating: 10V; Length: 1.6mm; Width: 800um; Height: 950um; Thickness: 800um; RoHS Compliant: Yes; ComponentLink1URL: https://datasheet.octopart.com/GRM188Z71A475KE15D-Murata-datasheet-149523299.pdf?src-supplier=Newark; ComponentLink1Description: https://datasheet.octopart.com/GRM188Z71A475KE15D-Murata-datasheet-149523299.pdf?src-supplier=Newark; ComponentLink2URL: https://datasheet.octopart.com/GRM188Z71A475KE15D-Murata-datasheet-165579666.pdf?src-supplier=TME; ComponentLink2Description: https://datasheet.octopart.com/GRM188Z71A475KE15D-Murata-datasheet-165579666.pdf?src-supplier=TME
J1 = DB2ERM-5.08-18P-GN: 320V 20A 18 Bend -40℃~+105℃ 1 5.08mm 1x18P Green Receptacle-Close Screw Fixing Push-Pull,P=5.08mm Pluggable System Terminal Block ROHS; Manufacturer: DORABO; Manufacturer Part Number: DB2ERM-5.08-18P-GN; Package: Push-Pull,P=5.08mm; LCSC Part Number: C430542; Item Type: Terminal Block; ComponentLink1Description: LCSC; ComponentLink1URL: https://www.lcsc.com/product-detail/Pluggable-System-Terminal-Block_DORABO-DB2ERM-5-08-18P-GN_C430542.html?s_z=n_DB2ERM-5.08-18P-GN
J2 = SFH11-PBPC-D12-RA-BK: CONN HDR 24POS 0.1 GOLD PCB R/A; Manufacturer: Sullins; Item Type: Connectors; Number of Positions: 24; Connector Type: Header; Pitch: 0.1inch; Supplier: Digikey; Manufacturer Part Number: SFH11-PBPC-D12-RA-BK; RoHS: Yes; Pricing: 1000=0.8853 (USD); Mounting Technology: Through Hole; Color: Black; Contact Plating: Gold; Package Quantity: 1000; Packaging: Tray; Number of Rows: 2; Termination: Solder; Series: SFH11; Contact Type: Female Socket; Row Spacing: 0.1inch; RoHS Compliant: Yes; ComponentLink1URL: http://sullinscorp.com/catalogs/147_PAGE119_.100_SFH11_SERIES_FEMALE_HDR_ST_RA.pdf?src-supplier=Digikey; ComponentLink1Description: http://sullinscorp.com/catalogs/147_PAGE119_.100_SFH11_SERIES_FEMALE_HDR_ST_RA.pdf?src-supplier=Digikey
J3 = DB2EKM-5.08-18P-GN-S: -40℃~+105℃ 2.5 1 14~28 5.08mm 320V 20A 18 1x18P Green Plug Screw Fixing P=5.08mm Pluggable System Terminal Block ROHS; Manufacturer: DORABO; Manufacturer Part Number: DB2EKM-5.08-18P-GN-S; Package: P=5.08mm; LCSC Part Number: C430525; Item Type: Terminal Block; ComponentLink1Description: LCSC; ComponentLink1URL: https://www.lcsc.com/product-detail/Pluggable-System-Terminal-Block_DORABO-DB2EKM-5-08-18P-GN-S_C430525.html?s_z=n_DB2EKM-5.08-18P-GN-S

## Nets that join several sheets
+3V3: Power-Processor-1-Sheet (7 pins), Power-Processor-2-Sheet (7 pins), Power-Processor-3-Sheet (7 pins), Connectors-Sheet (C82.2 C83.2 J2.9 J2.10)
NGND: Power-Processor-1-Sheet (59 pins), Power-Processor-2-Sheet (59 pins), Power-Processor-3-Sheet (59 pins), Connectors-Sheet (C82.1 C83.1 J2.11 J2.12)
VA_N: Power-Processor-1-Sheet (U1.19), Power-Processor-2-Sheet (U2.19), Power-Processor-3-Sheet (U3.19), Connectors-Sheet (J2.18)
VA_P: Power-Processor-1-Sheet (U1.20), Power-Processor-2-Sheet (U2.20), Power-Processor-3-Sheet (U3.20), Connectors-Sheet (J2.17)
VB_N: Power-Processor-1-Sheet (U1.21), Power-Processor-2-Sheet (U2.21), Power-Processor-3-Sheet (U3.21), Connectors-Sheet (J2.20)
VB_P: Power-Processor-1-Sheet (U1.22), Power-Processor-2-Sheet (U2.22), Power-Processor-3-Sheet (U3.22), Connectors-Sheet (J2.19)
VC_N: Power-Processor-1-Sheet (U1.23), Power-Processor-2-Sheet (U2.23), Power-Processor-3-Sheet (U3.23), Connectors-Sheet (J2.22)
VC_P: Power-Processor-1-Sheet (U1.24), Power-Processor-2-Sheet (U2.24), Power-Processor-3-Sheet (U3.24), Connectors-Sheet (J2.21)
IA_N1: Power-Processor-1-Sheet (D2.1 D2.2 R4.1 R5.1), Connectors-Sheet (J1.2)
IA_N2: Power-Processor-2-Sheet (D10.1 D10.2 R37.1 R38.1), Connectors-Sheet (J1.8)
IA_N3: Power-Processor-3-Sheet (D18.1 D18.2 R70.1 R71.1), Connectors-Sheet (J1.14)
IA_P1: Power-Processor-1-Sheet (D1.1 D1.2 R1.1 R3.2), Connectors-Sheet (J1.1)
IA_P2: Power-Processor-2-Sheet (D9.1 D9.2 R34.1 R36.2), Connectors-Sheet (J1.7)
IA_P3: Power-Processor-3-Sheet (D17.1 D17.2 R67.1 R69.2), Connectors-Sheet (J1.13)
IB_N1: Power-Processor-1-Sheet (D4.1 D4.2 R12.1 R13.1), Connectors-Sheet (J1.4)
IB_N2: Power-Processor-2-Sheet (D12.1 D12.2 R45.1 R46.1), Connectors-Sheet (J1.10)
IB_N3: Power-Processor-3-Sheet (D20.1 D20.2 R78.1 R79.1), Connectors-Sheet (J1.16)
IB_P1: Power-Processor-1-Sheet (D3.1 D3.2 R9.1 R11.2), Connectors-Sheet (J1.3)
IB_P2: Power-Processor-2-Sheet (D11.1 D11.2 R42.1 R44.2), Connectors-Sheet (J1.9)
IB_P3: Power-Processor-3-Sheet (D19.1 D19.2 R75.1 R77.2), Connectors-Sheet (J1.15)
IC_N1: Power-Processor-1-Sheet (D6.1 D6.2 R18.1 R19.1), Connectors-Sheet (J1.6)
IC_N2: Power-Processor-2-Sheet (D14.1 D14.2 R51.1 R52.1), Connectors-Sheet (J1.12)
IC_N3: Power-Processor-3-Sheet (D22.1 D22.2 R84.1 R85.1), Connectors-Sheet (J1.18)
IC_P1: Power-Processor-1-Sheet (D5.1 D5.2 R15.1 R17.2), Connectors-Sheet (J1.5)
IC_P2: Power-Processor-2-Sheet (D13.1 D13.2 R48.1 R50.2), Connectors-Sheet (J1.11)
IC_P3: Power-Processor-3-Sheet (D21.1 D21.2 R81.1 R83.2), Connectors-Sheet (J1.17)
MISO: Power-Processor-1-Sheet (U1.38), Power-Processor-2-Sheet (U2.38), Power-Processor-3-Sheet (U3.38), Connectors-Sheet (J2.2)
MOSI: Power-Processor-1-Sheet (U1.39), Power-Processor-2-Sheet (U2.39), Power-Processor-3-Sheet (U3.39), Connectors-Sheet (J2.3)
SCLK: Power-Processor-1-Sheet (U1.37), Power-Processor-2-Sheet (U2.37), Power-Processor-3-Sheet (U3.37), Connectors-Sheet (J2.1)
SS1: Power-Processor-1-Sheet (U1.40), Connectors-Sheet (J2.6)
SS2: Power-Processor-2-Sheet (U2.40), Connectors-Sheet (J2.5)
SS3: Power-Processor-3-Sheet (U3.40), Connectors-Sheet (J2.4)